# Altium schematic sheet clocks.SchDoc
size A4; SheetNumber: 3; SheetTotal: 4
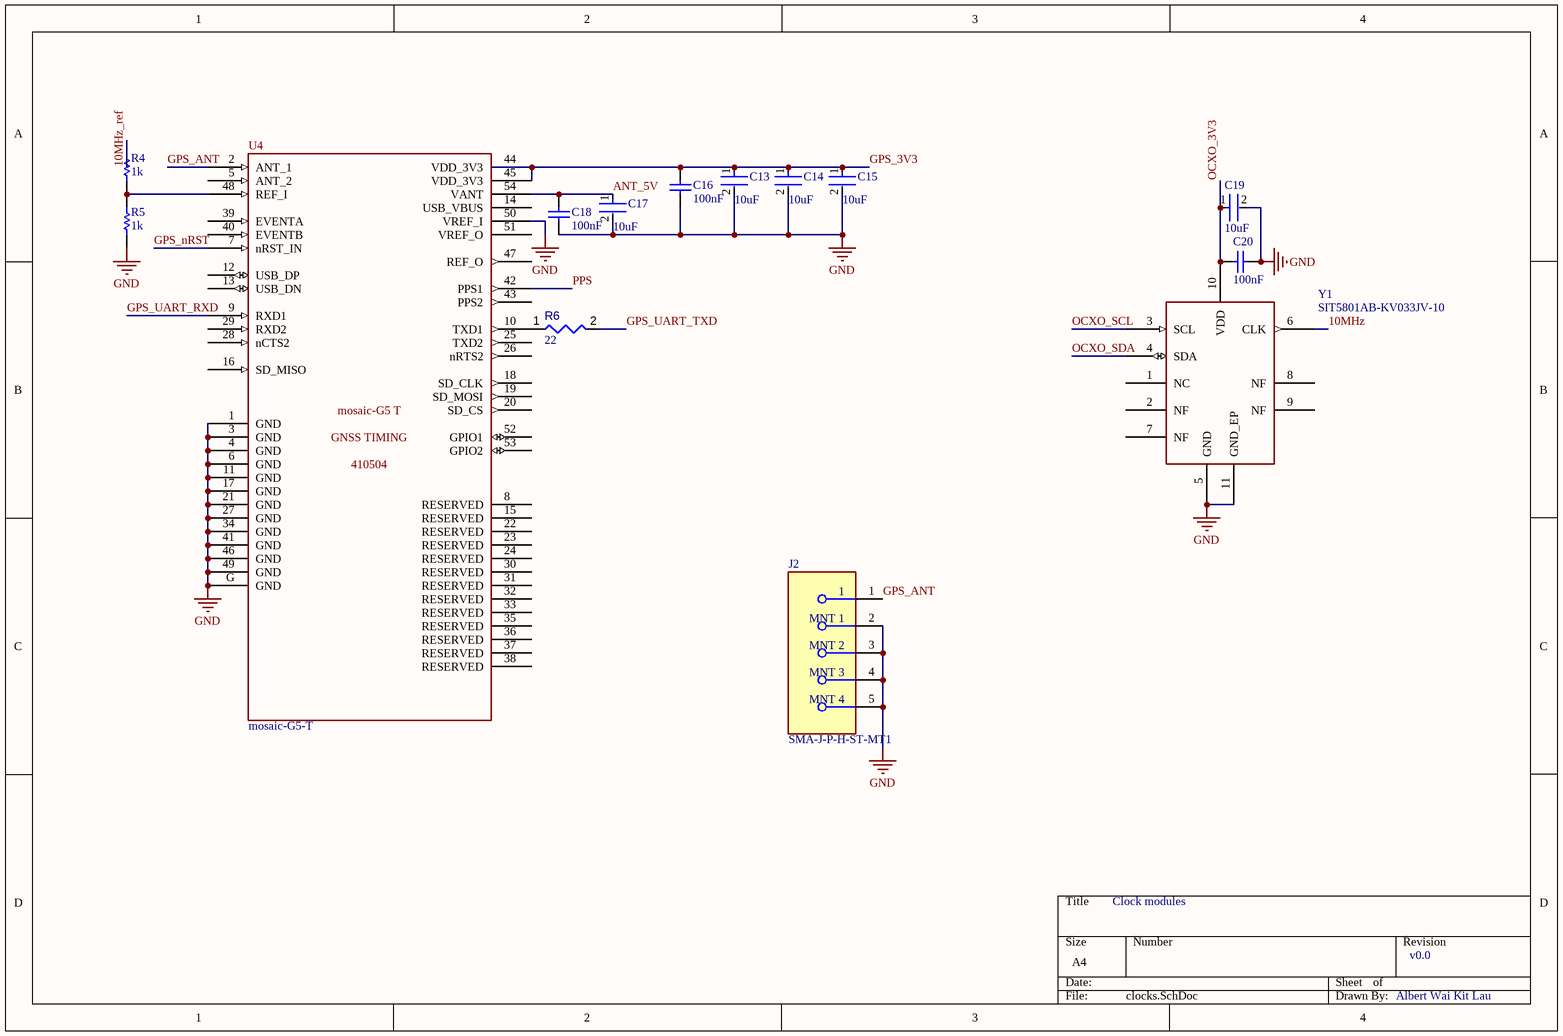
[diagram p0: clocks.SchDoc]

## Parts
C13  10uF  [FP-GRM21B-0_2-e0_2_0_7-IPC_A]
C14  10uF  [FP-GRM21B-0_2-e0_2_0_7-IPC_A]
C15  10uF  [FP-GRM21B-0_2-e0_2_0_7-IPC_A]
C16  100nF  [CAPC1050X55X23ML05T13]
C17  10uF  [FP-GRM21B-0_2-e0_2_0_7-IPC_A]
C18  100nF  [CAPC1050X55X23ML05T13]
C19  10uF  [FP-GRM21B-0_2-e0_2_0_7-IPC_A]
C20  100nF  [CAPC1050X55X23ML05T13]
J2  SMA-J-P-H-ST-MT1  [FP-SMA-J-P-H-ST-MT1-MFG]
R4  value 1k  [RESC1005X40X25ML05T05]  (hidden comment: Resistor 1k +/-1% 0402 100 mW)
R5  value 1k  [RESC1005X40X25ML05T05]  (hidden comment: Resistor 1k +/-1% 0402 100 mW)
R6  value 22  [RESC0402(1005)_L]  (hidden comment: 22R2J)
U4  mosaic-G5-T  [MOSAIC-G5_LGA54_22P8X16P4]
Y1  SIT5801AB-KV033JV-10  [SiT5801_K_9x7_LGA11]

## Nets
GND: C13.2 C14.2 C15.2 C16.2 C17.2 C18.2 C19.2 C20.1 J2.2(MNT_1) J2.3(MNT_2) J2.4(MNT_3) J2.5(MNT_4) R5.1 U4.1(GND) U4.3(GND) U4.4(GND) U4.6(GND) U4.11(GND) U4.17(GND) U4.21(GND) U4.27(GND) U4.34(GND) U4.41(GND) U4.46(GND) U4.49(GND) U4.50(VREF_I) U4.G(GND) Y1.5(GND) Y1.11(GND_EP)
10MHz: Y1.6(CLK)
10MHz_ref: R4.2
ANT_5V: C17.1 C18.1 U4.54(VANT)
GPS_3V3: C13.1 C14.1 C15.1 C16.1 U4.44(VDD_3V3) U4.45(VDD_3V3)
GPS_ANT: J2.1 U4.2(ANT_1)
GPS_nRST: U4.7(nRST_IN)
GPS_UART_RXD: U4.9(RXD1)
GPS_UART_TXD: R6.2
OCXO_3V3: C19.1 C20.2 Y1.10(VDD)
OCXO_SCL: Y1.3(SCL)
OCXO_SDA: Y1.4(SDA)
PPS: U4.42(PPS1)
NetR4_1: R4.1 R5.2 U4.48(REF_I)
NetR6_1: R6.1 U4.10(TXD1)

Not connected (* = marked no-connect by the designer): U4 5(ANT_2) 8(RESERVED) 12(USB_DP) 13(USB_DN) 14(USB_VBUS) 15(RESERVED) 16(SD_MISO) 18(SD_CLK) 19(SD_MOSI) 20(SD_CS) 22(RESERVED) 23(RESERVED) 24(RESERVED) 25(TXD2) 26(nRTS2) 28(nCTS2) 29(RXD2) 30(RESERVED) 31(RESERVED) 32(RESERVED) 33(RESERVED) 35(RESERVED) 36(RESERVED) 37(RESERVED) 38(RESERVED) 39(EVENTA) 40(EVENTB) 43(PPS2) 47(REF_O) 51(VREF_O) 52(GPIO1) 53(GPIO2); Y1 1(NC) 2(NF) 7(NF) 8(NF) 9(NF)

## Notes on the sheet
- Clock modules
- v0.0
- Albert Wai Kit Lau
- (in symbol mosaic-G5-T) mosaic-G5 T; GNSS TIMING; 410504

## Library data of the parts
C13-C15 C17 C19 = CMP-06035-004402-1: Chip Multilayer Ceramic Capacitors for General Purpose, 0805, 10uF, X5R, 15%, 10%, 50V; Voltage Rating (DC): 50V; Dielectric: X5R; Tolerance: 10%; Capacitance: 10uF; Thickness: 1.25mm; Length: 2mm; Width: 1.25mm; JLCPCB: C440198
C16 C18 C20 = CMP-2000-05439-1: Chip Capacitor, 100 nF, +/- 10%, 16 V, -55 to 125 degC, 0402 (1005 Metric), RoHS, Tape and Reel; Manufacturer: Samsung Electro-Mechanics; Capacitance: 100000pF; Dielectric: X7R; Rated Voltage: 16V; Case Size/Dimension: 0402; Tolerance (%): ±10%; Manufacturer URL: http://www.samsungsem.com/global/index.jsp; Datasheet URL: https://datasheet.ciiva.com/29198/458718-da-01-en-vs-kondensator-0402-29198423.pdf; Datasheet Version: Nov-10; JLCPCB: C1525
J2 = CMP-002-00073-1: RF Connectors / Coaxial Connectors 6 GHz, 50 Ohm SMA Jack or Plug, Cable Connector; Case/Package: SMA; Mounting Technology: Through Hole
R4 R5 = CMP-009-00009-5: Chip Resistor, 1 KOhm, +/- 1%, 0.1 W, -55 to 155 degC, 0402 (1005 Metric); Power: 100mW; Voltage Rating: 50V; Min Operating Temperature: -55°C; Max Operating Temperature: 155°C; RoHS Compliant: True; Mounting Technology: SM; Pins: 2; Tolerance: 1%; Case/Package: 0402; JLCPCB: C11702
R6 = CMP-009-00082-2: 22R 0.063W 5% 0402 (1005 Metric)  SMD; Power: 63mW; Tolerance: 5%; Case/Package: 0402; Pins: 2; Mounting Technology: SMT; JLCPCB: C25092
U4 = mosaic-G5-T: Septentrio mosaic-G5 T multi-frequency GNSS timing receiver module, manufacturer part 410504. The 40 internal ground lands are represented by logical pin G and must be tied to ground. Pin 5 (ANT_2) is unsupported on the single-antenna T model and must be left unconnected.; pin to pad: G>G01
Y1 = SIT5801AB-KV033JV-10: SiTime SiT5801 10 MHz digitally controlled precision OCXO, exact AB-KV033JV-10 ordering variant; Frequency: 10 MHz; Supply Voltage: 3.3 V; Output: Regulated LVCMOS; Frequency Stability: ±3 ppb; Control Interface: I2C, factory-programmed address code 0; Pull Clamp: ±3.125 ppm; Manufacturer: SiTime; Manufacturer Part Number: SIT5801AB-KV033JV-10; Operating Temperature: -40 to +95 °C; Datasheet: SiT5801 Rev 0.26 (2023-05-04)